# Altium schematic sheet Sheet1.SchDoc
size A; SheetNumber: 1; SheetTotal: 1
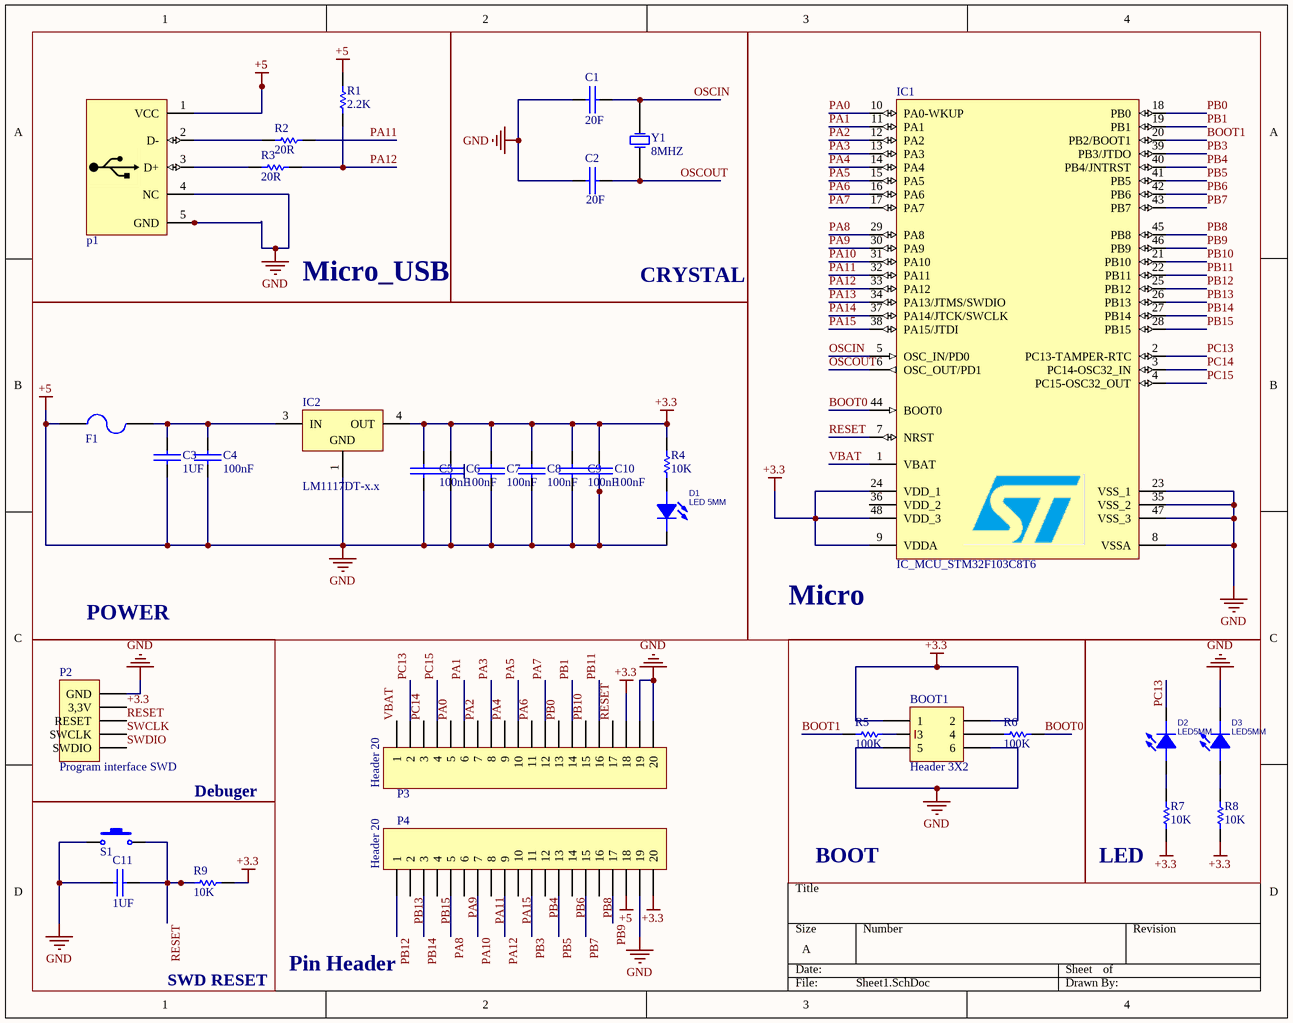
[diagram p0: Sheet1.SchDoc]

## Parts
BOOT1  Header 3X2  [IDC_2X3]
C1  20F  [Cap - 100nF]
C2  20F  [Cap - 100nF]
C3  1UF  [Cap - 100nF]
C4  100nF  [Cap - 100nF]
C5  100nF  [Cap - 100nF]
C6  100nF  [Cap - 100nF]
C7  100nF  [Cap - 100nF]
C8  100nF  [Cap - 100nF]
C9  100nF  [Cap - 100nF]
C10  100nF  [Cap - 100nF]
C11  1UF  [Cap - 100nF]
D1  LED 5MM  [LED5MM_GRN]
D2  LED5MM  [LED5MM_BLUE]
D3  LED5MM  [LED5MM_BLUE]
F1  F=1.0 A  [Fuse 5x20 With holder pin]  (value not drawn)
IC1  IC_MCU_STM32F103C8T6  [LQFP48_N]
IC2  LM1117DT-x.x  [TD03B_N]
p1  USB Connector  [USB_AB_BM_SHS]  (value not drawn)
P2  Program interface SWD  [HDR1X5]
P3  Header 20  [HDR1X20]
P4  Header 20  [HDR1X20]
R1  2.2K  [Axial 0_5W 5_0mm]
R2  20R  [Axial 0_5W 5_0mm]
R3  20R  [Axial 0_5W 5_0mm]
R4  10K  [Axial 2W 8_0mm]
R5  100K  [Axial 2W 8_0mm]
R6  100K  [Axial 2W 8_0mm]
R7  10K  [Axial 2W 8_0mm]
R8  10K  [Axial 2W 8_0mm]
R9  10K  [Axial 2W 8_0mm]
S1  Switch PB  [Switch - Push to On]  (value not drawn)
Y1  8MHZ  [CRYSTAL Small]

## Blocks framed on the sheet
Micro_USB: p1 R1-R3
CRYSTAL: C1 C2 Y1
Micro: IC1
POWER: P2
BOOT: BOOT1 R5 R6
LED: D2 D3 R7 R8

## Nets
+3.3: BOOT1.1 BOOT1.2 C5.1(+) C6.1(+) C7.1(+) C8.1(+) C9.1(+) C10.1(+) IC1.9(VDDA) IC1.24(VDD_1) IC1.48(VDD_3) IC2.4(OUT) P2.3.3V(3,3V) P3.18 P4.20 R4.2 R7.2 R8.2 R9.2
+5: BOOT1.5 BOOT1.6 C1.1(+) C2.1(+) C3.2(-) C4.2(-) C5.2(-) C6.2(-) C7.2(-) C8.2(-) C9.2(-) C10.2(-) C11.2(-) D1.2(CATHODE) D3.2(CATHODE) F1.1 IC1.8(VSSA) IC1.23(VSS_1) IC1.35(VSS_2) IC1.47(VSS_3) IC2.1(GND) p1.1(VCC) p1.4(NC) p1.5(GND) P2.GND P3.19 P3.20 P4.18 P4.19 R1.2 S1.1  [also labelled GND]
BOOT0: IC1.44(BOOT0) R6.1
BOOT1: IC1.20(PB2/BOOT1) R5.2
OSCIN: C1.2(-) IC1.5(OSC_IN/PD0) Y1.1(OSC1)
OSCOUT: C2.2(-) IC1.6(OSC_OUT/PD1) Y1.2(OSC2)
PA0: IC1.10(PA0-WKUP) P3.5
PA1: IC1.11(PA1) P3.6
PA2: IC1.12(PA2) P3.7
PA3: IC1.13(PA3) P3.8
PA4: IC1.14(PA4) P3.9
PA5: IC1.15(PA5) P3.10
PA6: IC1.16(PA6) P3.11
PA7: IC1.17(PA7) P3.12
PA8: IC1.29(PA8) P4.5
PA9: IC1.30(PA9) P4.6
PA10: IC1.31(PA10) P4.7
PA11: IC1.32(PA11) P4.8 R2.2
PA12: IC1.33(PA12) P4.9 R1.1 R3.2
PA13: IC1.34(PA13/JTMS/SWDIO)
PA14: IC1.37(PA14/JTCK/SWCLK)
PA15: IC1.38(PA15/JTDI) P4.10
PB0: IC1.18(PB0) P3.13
PB1: IC1.19(PB1) P3.14
PB3: IC1.39(PB3/JTDO) P4.11
PB4: IC1.40(PB4/JNTRST) P4.12
PB5: IC1.41(PB5) P4.13
PB6: IC1.42(PB6) P4.14
PB7: IC1.43(PB7) P4.15
PB8: IC1.45(PB8) P4.16
PB9: IC1.46(PB9) P4.17
PB10: IC1.21(PB10) P3.15
PB11: IC1.22(PB11) P3.16
PB12: IC1.25(PB12) P4.1
PB13: IC1.26(PB13) P4.2
PB14: IC1.27(PB14) P4.3
PB15: IC1.28(PB15) P4.4
PC13: D2.2(CATHODE) IC1.2(PC13-TAMPER-RTC) P3.2
PC14: IC1.3(PC14-OSC32_IN) P3.3
PC15: IC1.4(PC15-OSC32_OUT) P3.4
RESET: C11.1(+) IC1.7(NRST) P2.RESET P3.17 R9.1 S1.2
SWCLK: P2.SWCLK
SWDIO: P2.SWDIO
VBAT: IC1.1(VBAT) P3.1
NetBOOT1_3: BOOT1.3 R5.1
NetBOOT1_4: BOOT1.4 R6.2
NetC3_1: C3.1(+) C4.1(+) F1.2 IC2.3(IN)
NetD2_1: D2.1(ANODE) R7.1
NetD3_1: D3.1(ANODE) R8.1
Netp1_2: p1.2(D-) R2.1
Netp1_3: p1.3(D+) R3.1

Not connected (* = marked no-connect by the designer): D1 1(ANODE); IC1 36(VDD_2); R4 1

## Notes on the sheet
- Debuger
- Pin Header
- SWD RESET

## Library data of the parts
BOOT1 = Header 3X2: Header, 3-Pin, Dual row; LatestRevisionDate: 17-Jul-2002; LatestRevisionNote: Re-released for DXP Platform.; Publisher: Altium Limited
C1-C11 = Cap-Bipolar: Bipolar Capacitor; Voltage: 100V; Designer: Saeid Jorablo; Organazation: ControTec; Adding Date: 1387/12/20
  C1 C2: Value: 20F
  C3 C11: Value: 1UF
  C4-C10: Value: 100nF
D1 = LED 5MM: Light Emitting Diode; Designer: Abbas Basereh; Data: 16-12-2016; Link: *; Part.No: *
D2 D3 = LED5MM: LED LIGHTING; Designer: Abbas Basereh; Data: 16-12-2016; Link: *; Part.No: *
F1 = Fuse 5x20 with holdeer pins: Fuses 5x20; Designer: Abbas Basereh; Desc.: fuse with holder pins 5x20; Data: 28-12-2016
IC1 = IC_MCU_STM32F103C8T6: STM32 ARM-based 32-bit MCU with 64 Kbytes Flash, 48-pin LQFP, Industrial Temperature; Manufacturer: ST Microelectronics; Company: SJ Libraries; Designer: Eng. Saeid Jorablo; Revision 1: 7/16/2012: Add Model; Voltage: 2.0-3.6 (v); Published: 30-May-2008; DatasheetVersion: rev6, Mar-2008; PackageReference: LQFP48; Publisher: Saeid UnLimited; PackageDescription: 48-Pin Low-Profile Quad Flat Pack, 7 x 7 mm Body, 0.5 mm Pitch (LQFP48); ComponentLink1Description: Datasheet; ComponentLink1URL: http://www.st.com/stonline/products/literature/ds/13587.pdf; ComponentLink2Description: Reference; ComponentLink2URL: www.st.com/stm32; Mounting Technology: Surface Mount; PinCount: 48; TYPE: IC; Supplier 1: Digi-Key; Supplier 2: Farnell; Supplier 3: Farnell; Supplier 4: Digi-Key; Supplier Part Number 1: 497-11517-ND; Supplier Part Number 2: 1899017; Supplier Part Number 3: 1447637; Supplier Part Number 4: 497-6063-ND; HelpURL: http://s3.picofile.com/file/7443264187/Coming_Soon_logo.gif
IC2 = LM1117DT-x.x: x.x Volt, 800mA Low-Dropout Linear Regulator, 3-pin TO-252; PartNumber: LM1117DT-3.3; Manufacturer: National Semiconductor; PackageTopMarking: NSUZXYTT*LM1117*DT-X.X; PowerWise: N; CompType: LDO IC; DatasheetVersion: Apr-2006; PackageVersion: revD, Feb-2009; PackageReference: TD03B; PackageDescription: TO252, Molded, Jedec, 6.8 x 6.10 x 2.30mm Body, 3 Lead, 2.28mm Pitch, Surface Mount; Supplier 1: Farnell; Supplier 2: Farnell; RoHS: N; PinCount: 3; Code_JEDEC: TO-252-AA; ComponentLink1Description: LM1117 Datasheet; ComponentLink1URL: http://www.national.com/ds/LM/LM1117.pdf; ComponentLink2Description: LM1117 Web Page; ComponentLink2URL: http://www.national.com/pf/LM/LM1117.html; ComponentLink3Description: TD03B Package Page; ComponentLink3URL: http://www.national.com/packaging/folders/td03b.html
p1 = USB MICRO: USB Connector MICRO-B Type; Designer: ABBAS BASEREH; Max Current: 1600mA; Mounting Technology: Surface Mount\Through-Hole; Category: Connector; Pin Count: 5-7; Publisher: ABBAS BASEREH; Status: Unreleased; ComponentLink1Description: Datasheet; ComponentLink2Description: Reference; Update: 1395-11-17
P2 = Header 5: Header, 5-Pin; LatestRevisionDate: 17-Jul-2002; LatestRevisionNote: Re-released for DXP Platform.; Publisher: Altium Limited
P3 P4 = Header 20: Header, 20-Pin; LatestRevisionDate: 17-Jul-2002; LatestRevisionNote: Re-released for DXP Platform.; Publisher: Altium Limited
R1-R3 = RES Axial 0.5W: Designer: Abbas Basereh; Desc.: RES Axial 0.5W; Data: 4-1-2017
R4-R9 = RES Axial 2W: Designer: Abbas Basereh; Desc.: RES Axial 2W; Data: 4-1-2017
S1 = Switch PB: Push Button Switch
Y1 = XTAL_Crystal: XTAL Crystal; Designer: ABBAS BASEREH; Value: 12 MHz; Design Date: 2017-1-3; ComponentLink1Description: Datasheet; ComponentLink2Description: Reference; Mounting Technology: Surface Mount\Through-Hole; Status: Unreleased